# Altium schematic sheet IDC_Tester_v1_sift_register_input.SchDoc
size 420 x 297 mm; SheetNumber: 10; SheetTotal: 10
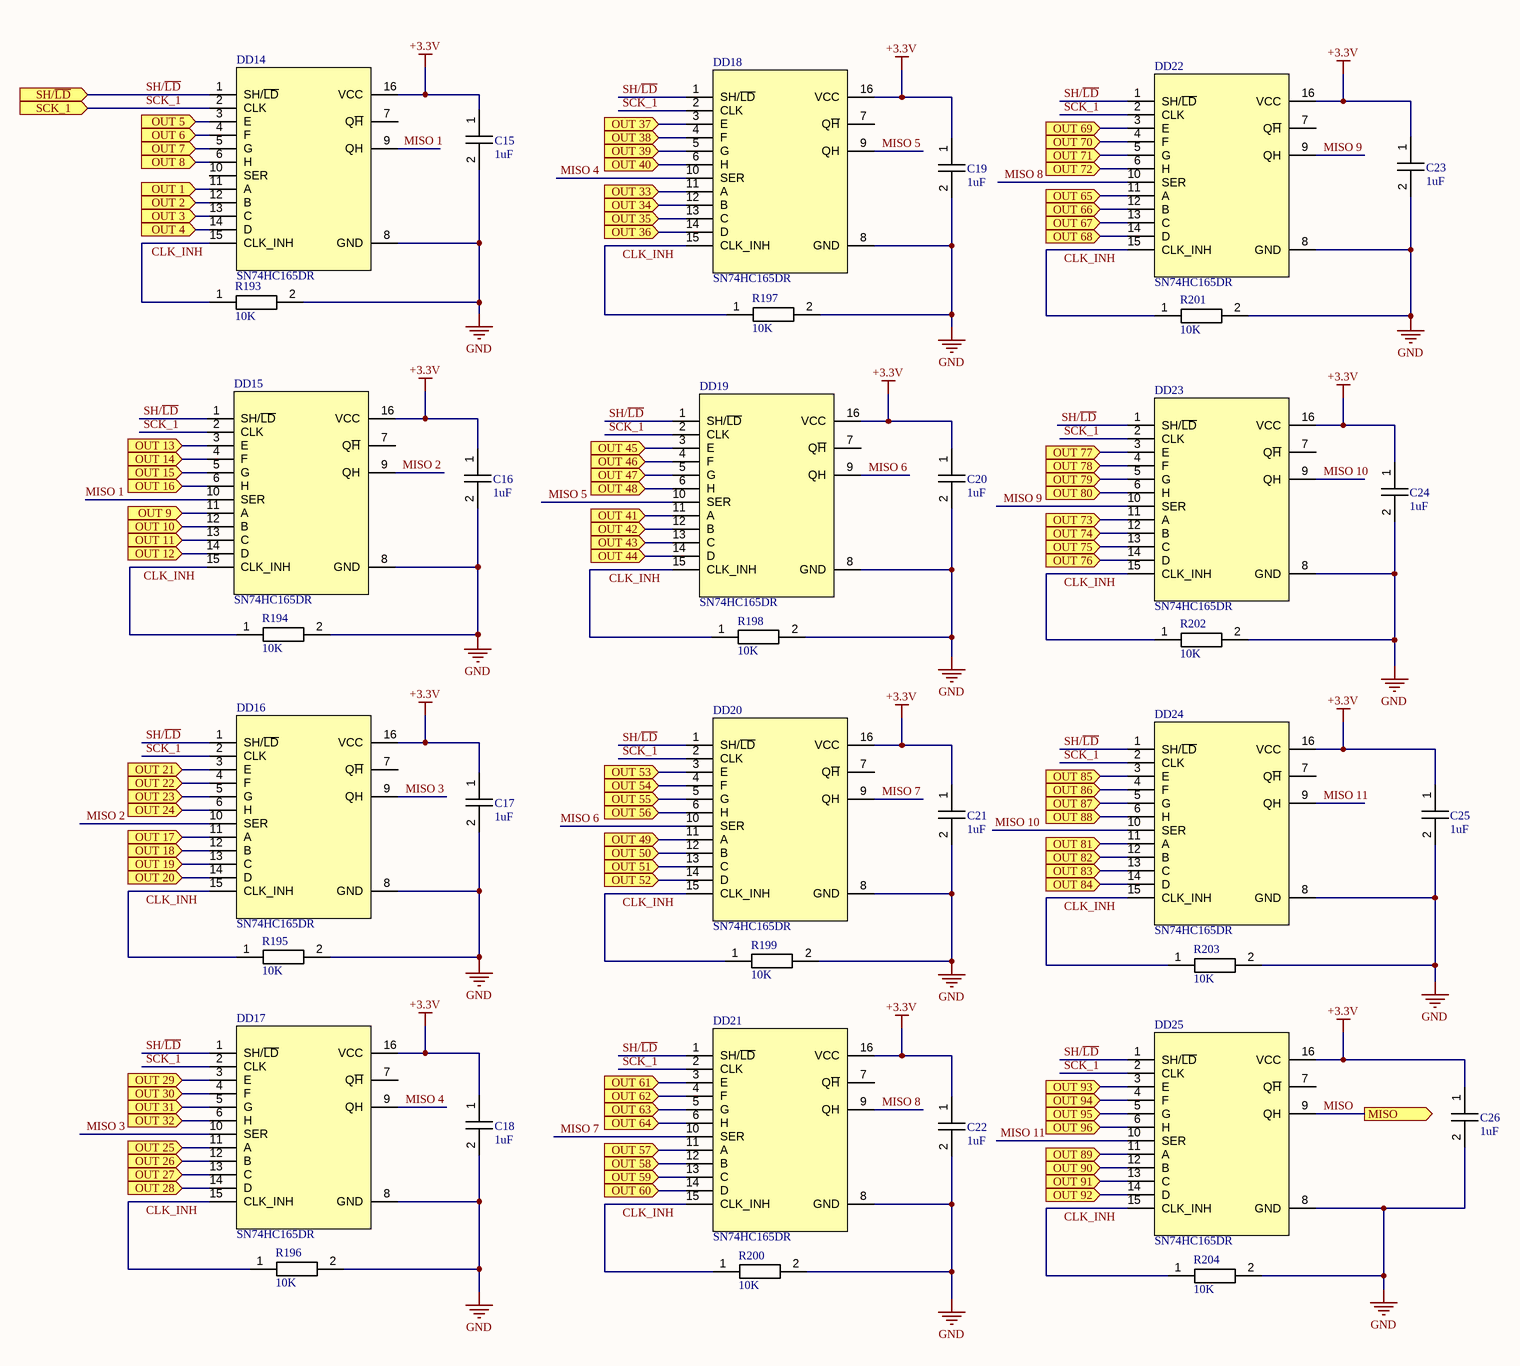
[diagram p0: IDC_Tester_v1_sift_register_input.SchDoc]

## Parts
C15  1uF  [Capacitor 0603]
C16  1uF  [Capacitor 0603]
C17  1uF  [Capacitor 0603]
C18  1uF  [Capacitor 0603]
C19  1uF  [Capacitor 0603]
C20  1uF  [Capacitor 0603]
C21  1uF  [Capacitor 0603]
C22  1uF  [Capacitor 0603]
C23  1uF  [Capacitor 0603]
C24  1uF  [Capacitor 0603]
C25  1uF  [Capacitor 0603]
C26  1uF  [Capacitor 0603]
DD14  SN74HC165DR  [Shift register 74HC165 or 74HC595]
DD15  SN74HC165DR  [Shift register 74HC165 or 74HC595]
DD16  SN74HC165DR  [Shift register 74HC165 or 74HC595]
DD17  SN74HC165DR  [Shift register 74HC165 or 74HC595]
DD18  SN74HC165DR  [Shift register 74HC165 or 74HC595]
DD19  SN74HC165DR  [Shift register 74HC165 or 74HC595]
DD20  SN74HC165DR  [Shift register 74HC165 or 74HC595]
DD21  SN74HC165DR  [Shift register 74HC165 or 74HC595]
DD22  SN74HC165DR  [Shift register 74HC165 or 74HC595]
DD23  SN74HC165DR  [Shift register 74HC165 or 74HC595]
DD24  SN74HC165DR  [Shift register 74HC165 or 74HC595]
DD25  SN74HC165DR  [Shift register 74HC165 or 74HC595]
R193  10K  [Resistor 0603]
R194  10K  [Resistor 0603]
R195  10K  [Resistor 0603]
R196  10K  [Resistor 0603]
R197  10K  [Resistor 0603]
R198  10K  [Resistor 0603]
R199  10K  [Resistor 0603]
R200  10K  [Resistor 0603]
R201  10K  [Resistor 0603]
R202  10K  [Resistor 0603]
R203  10K  [Resistor 0603]
R204  10K  [Resistor 0603]

## Ports
MISO (out), OUT 1 (in), OUT 2 (in), OUT 3 (in), OUT 4 (in), OUT 5 (in), OUT 6 (in), OUT 7 (in), OUT 8 (in), OUT 9 (in), OUT 10 (in), OUT 11 (in), OUT 12 (in), OUT 13 (in), OUT 14 (in), OUT 15 (in), OUT 16 (in), OUT 17 (in), OUT 18 (in), OUT 19 (in), OUT 20 (in), OUT 21 (in), OUT 22 (in), OUT 23 (in), OUT 24 (in), OUT 25 (in), OUT 26 (in), OUT 27 (in), OUT 28 (in), OUT 29 (in), OUT 30 (in), OUT 31 (in), OUT 32 (in), OUT 33 (in), OUT 34 (in), OUT 35 (in), OUT 36 (in), OUT 37 (in), OUT 38 (in), OUT 39 (in), OUT 40 (in), OUT 41 (in), OUT 42 (in), OUT 43 (in), OUT 44 (in), OUT 45 (in), OUT 46 (in), OUT 47 (in), OUT 48 (in), OUT 49 (in), OUT 50 (in), OUT 51 (in), OUT 52 (in), OUT 53 (in), OUT 54 (in), OUT 55 (in), OUT 56 (in), OUT 57 (in), OUT 58 (in), OUT 59 (in), OUT 60 (in), OUT 61 (in), OUT 62 (in), OUT 63 (in), OUT 64 (in), OUT 65 (in), OUT 66 (in), OUT 67 (in), OUT 68 (in), OUT 69 (in), OUT 70 (in), OUT 71 (in), OUT 72 (in), OUT 73 (in), OUT 74 (in), OUT 75 (in), OUT 76 (in), OUT 77 (in), OUT 78 (in), OUT 79 (in), OUT 80 (in), OUT 81 (in), OUT 82 (in), OUT 83 (in), OUT 84 (in), OUT 85 (in), OUT 86 (in), OUT 87 (in), OUT 88 (in), OUT 89 (in), OUT 90 (in), OUT 91 (in), OUT 92 (in), OUT 93 (in), OUT 94 (in), OUT 95 (in), OUT 96 (in), SCK_1 (in), SH/~{LD} (in)

## Nets
+3.3V: C15.1 C16.1 C17.1 C18.1 C19.1 C20.1 C21.1 C22.1 C23.1 C24.1 C25.1 C26.1 DD14.16(VCC) DD15.16(VCC) DD16.16(VCC) DD17.16(VCC) DD18.16(VCC) DD19.16(VCC) DD20.16(VCC) DD21.16(VCC) DD22.16(VCC) DD23.16(VCC) DD24.16(VCC) DD25.16(VCC)
GND: C15.2 C16.2 C17.2 C18.2 C19.2 C20.2 C21.2 C22.2 C23.2 C24.2 C25.2 C26.2 DD14.8(GND) DD15.8(GND) DD16.8(GND) DD17.8(GND) DD18.8(GND) DD19.8(GND) DD20.8(GND) DD21.8(GND) DD22.8(GND) DD23.8(GND) DD24.8(GND) DD25.8(GND) R193.2 R194.2 R195.2 R196.2 R197.2 R198.2 R199.2 R200.2 R201.2 R202.2 R203.2 R204.2
CLK_INH: DD14.15(CLK_INH) DD15.15(CLK_INH) DD16.15(CLK_INH) DD17.15(CLK_INH) DD18.15(CLK_INH) DD19.15(CLK_INH) DD20.15(CLK_INH) DD21.15(CLK_INH) DD22.15(CLK_INH) DD23.15(CLK_INH) DD24.15(CLK_INH) DD25.15(CLK_INH) R193.1 R194.1 R195.1 R196.1 R197.1 R198.1 R199.1 R200.1 R201.1 R202.1 R203.1 R204.1
MISO: DD25.9(QH) ; port MISO
MISO 1: DD14.9(QH) DD15.10(SER)
MISO 2: DD15.9(QH) DD16.10(SER)
MISO 3: DD16.9(QH) DD17.10(SER)
MISO 4: DD17.9(QH) DD18.10(SER)
MISO 5: DD18.9(QH) DD19.10(SER)
MISO 6: DD19.9(QH) DD20.10(SER)
MISO 7: DD20.9(QH) DD21.10(SER)
MISO 8: DD21.9(QH) DD22.10(SER)
MISO 9: DD22.9(QH) DD23.10(SER)
MISO 10: DD23.9(QH) DD24.10(SER)
MISO 11: DD24.9(QH) DD25.10(SER)
OUT 1: DD14.11(A) ; port OUT 1
OUT 2: DD14.12(B) ; port OUT 2
OUT 3: DD14.13(C) ; port OUT 3
OUT 4: DD14.14(D) ; port OUT 4
OUT 5: DD14.3(E) ; port OUT 5
OUT 6: DD14.4(F) ; port OUT 6
OUT 7: DD14.5(G) ; port OUT 7
OUT 8: DD14.6(H) ; port OUT 8
OUT 9: DD15.11(A) ; port OUT 9
OUT 10: DD15.12(B) ; port OUT 10
OUT 11: DD15.13(C) ; port OUT 11
OUT 12: DD15.14(D) ; port OUT 12
OUT 13: DD15.3(E) ; port OUT 13
OUT 14: DD15.4(F) ; port OUT 14
OUT 15: DD15.5(G) ; port OUT 15
OUT 16: DD15.6(H) ; port OUT 16
OUT 17: DD16.11(A) ; port OUT 17
OUT 18: DD16.12(B) ; port OUT 18
OUT 19: DD16.13(C) ; port OUT 19
OUT 20: DD16.14(D) ; port OUT 20
OUT 21: DD16.3(E) ; port OUT 21
OUT 22: DD16.4(F) ; port OUT 22
OUT 23: DD16.5(G) ; port OUT 23
OUT 24: DD16.6(H) ; port OUT 24
OUT 25: DD17.11(A) ; port OUT 25
OUT 26: DD17.12(B) ; port OUT 26
OUT 27: DD17.13(C) ; port OUT 27
OUT 28: DD17.14(D) ; port OUT 28
OUT 29: DD17.3(E) ; port OUT 29
OUT 30: DD17.4(F) ; port OUT 30
OUT 31: DD17.5(G) ; port OUT 31
OUT 32: DD17.6(H) ; port OUT 32
OUT 33: DD18.11(A) ; port OUT 33
OUT 34: DD18.12(B) ; port OUT 34
OUT 35: DD18.13(C) ; port OUT 35
OUT 36: DD18.14(D) ; port OUT 36
OUT 37: DD18.3(E) ; port OUT 37
OUT 38: DD18.4(F) ; port OUT 38
OUT 39: DD18.5(G) ; port OUT 39
OUT 40: DD18.6(H) ; port OUT 40
OUT 41: DD19.11(A) ; port OUT 41
OUT 42: DD19.12(B) ; port OUT 42
OUT 43: DD19.13(C) ; port OUT 43
OUT 44: DD19.14(D) ; port OUT 44
OUT 45: DD19.3(E) ; port OUT 45
OUT 46: DD19.4(F) ; port OUT 46
OUT 47: DD19.5(G) ; port OUT 47
OUT 48: DD19.6(H) ; port OUT 48
OUT 49: DD20.11(A) ; port OUT 49
OUT 50: DD20.12(B) ; port OUT 50
OUT 51: DD20.13(C) ; port OUT 51
OUT 52: DD20.14(D) ; port OUT 52
OUT 53: DD20.3(E) ; port OUT 53
OUT 54: DD20.4(F) ; port OUT 54
OUT 55: DD20.5(G) ; port OUT 55
OUT 56: DD20.6(H) ; port OUT 56
OUT 57: DD21.11(A) ; port OUT 57
OUT 58: DD21.12(B) ; port OUT 58
OUT 59: DD21.13(C) ; port OUT 59
OUT 60: DD21.14(D) ; port OUT 60
OUT 61: DD21.3(E) ; port OUT 61
OUT 62: DD21.4(F) ; port OUT 62
OUT 63: DD21.5(G) ; port OUT 63
OUT 64: DD21.6(H) ; port OUT 64
OUT 65: DD22.11(A) ; port OUT 65
OUT 66: DD22.12(B) ; port OUT 66
OUT 67: DD22.13(C) ; port OUT 67
OUT 68: DD22.14(D) ; port OUT 68
OUT 69: DD22.3(E) ; port OUT 69
OUT 70: DD22.4(F) ; port OUT 70
OUT 71: DD22.5(G) ; port OUT 71
OUT 72: DD22.6(H) ; port OUT 72
OUT 73: DD23.11(A) ; port OUT 73
OUT 74: DD23.12(B) ; port OUT 74
OUT 75: DD23.13(C) ; port OUT 75
OUT 76: DD23.14(D) ; port OUT 76
OUT 77: DD23.3(E) ; port OUT 77
OUT 78: DD23.4(F) ; port OUT 78
OUT 79: DD23.5(G) ; port OUT 79
OUT 80: DD23.6(H) ; port OUT 80
OUT 81: DD24.11(A) ; port OUT 81
OUT 82: DD24.12(B) ; port OUT 82
OUT 83: DD24.13(C) ; port OUT 83
OUT 84: DD24.14(D) ; port OUT 84
OUT 85: DD24.3(E) ; port OUT 85
OUT 86: DD24.4(F) ; port OUT 86
OUT 87: DD24.5(G) ; port OUT 87
OUT 88: DD24.6(H) ; port OUT 88
OUT 89: DD25.11(A) ; port OUT 89
OUT 90: DD25.12(B) ; port OUT 90
OUT 91: DD25.13(C) ; port OUT 91
OUT 92: DD25.14(D) ; port OUT 92
OUT 93: DD25.3(E) ; port OUT 93
OUT 94: DD25.4(F) ; port OUT 94
OUT 95: DD25.5(G) ; port OUT 95
OUT 96: DD25.6(H) ; port OUT 96
SCK_1: DD14.2(CLK) DD15.2(CLK) DD16.2(CLK) DD17.2(CLK) DD18.2(CLK) DD19.2(CLK) DD20.2(CLK) DD21.2(CLK) DD22.2(CLK) DD23.2(CLK) DD24.2(CLK) DD25.2(CLK) ; port SCK_1
SH/~{LD}: DD14.1(SH/~{LD}) DD15.1(SH/~{LD}) DD16.1(SH/~{LD}) DD17.1(SH/~{LD}) DD18.1(SH/~{LD}) DD19.1(SH/~{LD}) DD20.1(SH/~{LD}) DD21.1(SH/~{LD}) DD22.1(SH/~{LD}) DD23.1(SH/~{LD}) DD24.1(SH/~{LD}) DD25.1(SH/~{LD}) ; port SH/~{LD}

Not connected (* = marked no-connect by the designer): DD14 7(Q~{H}) 10(SER); DD15 7(Q~{H}); DD16 7(Q~{H}); DD17 7(Q~{H}); DD18 7(Q~{H}); DD19 7(Q~{H}); DD20 7(Q~{H}); DD21 7(Q~{H}); DD22 7(Q~{H}); DD23 7(Q~{H}); DD24 7(Q~{H}); DD25 7(Q~{H})

## Notes on the sheet
- THIS DOCUMENT AND THE DATA DISCLOSED HEREIN OR
- HEREWITH IS THE PROPERTY OF ALTIUM LIMITED AND MAY
- DWG NO:
- REVISION
- REV:
- DESCRIPTION
- DATE
- APPROVED
- BE FREELY DISTRIBUTED IN WHOLE. NO RIGHTS ARE
- RESERVED OR EXPRESS OR IMPLIED WARANTEE GIVEN.
- ENG:
- APPROVALS
- PROJECT
- DSN:
- CHK:
- REFERENCE DOCUMENTS
- PROJECT REVISION:
- TITLE
- DOCUMENT REVISION:
- DESIGN ITEM:
- BOM:
- FAB DWG:
- PCB DWG:
- ASSY DWG:
- SCALE:
- A3
- SIZE
- CAGE CODE
- FILE NAME
- DWG NO.
- SHEET
- OF
- REV

## Library data of the parts
C15-C26 = Capacitor: Part Number: SMD CAP CER 1UF 25V X5R 0603 (CC0603KRX5R8BB105); Added by: viskov2055@gmail.com; Mount_Type: SMD; Solder_Amount: 2; Pkg: 0603; Created at: 16/02/2024; Mount: MOUNT
DD14-DD25 = SN74HC165DR: IC 8-BIT SHIFT REGISTER 16-SOIC; Manufacturer: Texas Instruments; Added by: viskov2055@gmail.com; Mount_Type: SMD; Solder_Amount: 16; Supplier 1: Digikey; Manufacturer Part Number: SN74HC165DR; RoHS: Yes; Category: Shift Registers; Stock 1: 2933; Pricing 1: 1=0,47, 10=0,357, 25=0,322, 100=0,2226, 250=0,18744, 500=0,1523, 1000=0,11716 (USD); ComponentLink1URL: https://datasheet.ciiva.com/15093/getdatasheetpartid-251161-15093655.pdf?src-supplier=Verical; ComponentLink1Description: https://datasheet.ciiva.com/15093/getdatasheetpartid-251161-15093655.pdf?src-supplier=Verical; ComponentLink2URL: https://datasheet.ciiva.com/34301/915180-34301754.pdf?src-supplier=Jameco; ComponentLink2Description: https://datasheet.ciiva.com/34301/915180-34301754.pdf?src-supplier=Jameco; ComponentLink3URL: https://datasheet.ciiva.com/41456/001016679-da-01-en-ic-8bit-shft-reg-sn74hc165dr-soic-16-tid-41456900.pdf?src-supplier=Conrad; ComponentLink3Description: https://datasheet.ciiva.com/41456/001016679-da-01-en-ic-8bit-shft-reg-sn74hc165dr-soic-16-tid-41456900.pdf?src-supplier=Conrad; ComponentLink4URL: https://datasheet.ciiva.com/46397/1831348-46397223.pdf?src-supplier=Element14; ComponentLink4Description: https://datasheet.ciiva.com/46397/1831348-46397223.pdf?src-supplier=Element14; ComponentLink5URL: https://datasheet.ciiva.com/14295/sn54hc165-14295050.pdf?src-supplier=Avnet; ComponentLink5Description: https://datasheet.ciiva.com/14295/sn54hc165-14295050.pdf?src-supplier=Avnet; ComponentLink6URL: https://datasheet.ciiva.com/14295/sn54hc165-14295052.pdf?src-supplier=Avnet; ComponentLink6Description: https://datasheet.ciiva.com/14295/sn54hc165-14295052.pdf?src-supplier=Avnet; ComponentLink7URL: https://datasheet.ciiva.com/1886/sn74hc165-1886212.pdf?src-supplier=Digikey; ComponentLink7Description: https://datasheet.ciiva.com/1886/sn74hc165-1886212.pdf?src-supplier=Digikey; ComponentLink8URL: https://datasheet.ciiva.com/1886/sn74hc165-1886213.pdf?src-supplier=Digikey; ComponentLink8Description: https://datasheet.ciiva.com/1886/sn74hc165-1886213.pdf?src-supplier=Digikey; ComponentLink9URL: https://datasheet.ciiva.com/1886/sn74hc165-1886214.pdf?src-supplier=Digikey; ComponentLink9Description: https://datasheet.ciiva.com/1886/sn74hc165-1886214.pdf?src-supplier=Digikey; Supplier Part Number 1: 296-8250-1-ND; Created at: 13/02/2024; Mount: MOUNT; Pkg: 16-SOIC; Part number: SN74HC165DR
R193-R204 = Resistor 10K: Part Number: SMD RES 10K OHM 1%±100ppm/°C 0603 (RMCF0603FT10K0); Added by: viskov2055@gmail.com; Mount_Type: SMD; Solder_Amount: 2; Pkg: 0603; Created at: 15/02/2024; Mount: MOUNT